# Altium project esp32h2-zigbee-blinds_v1.PrjPcb
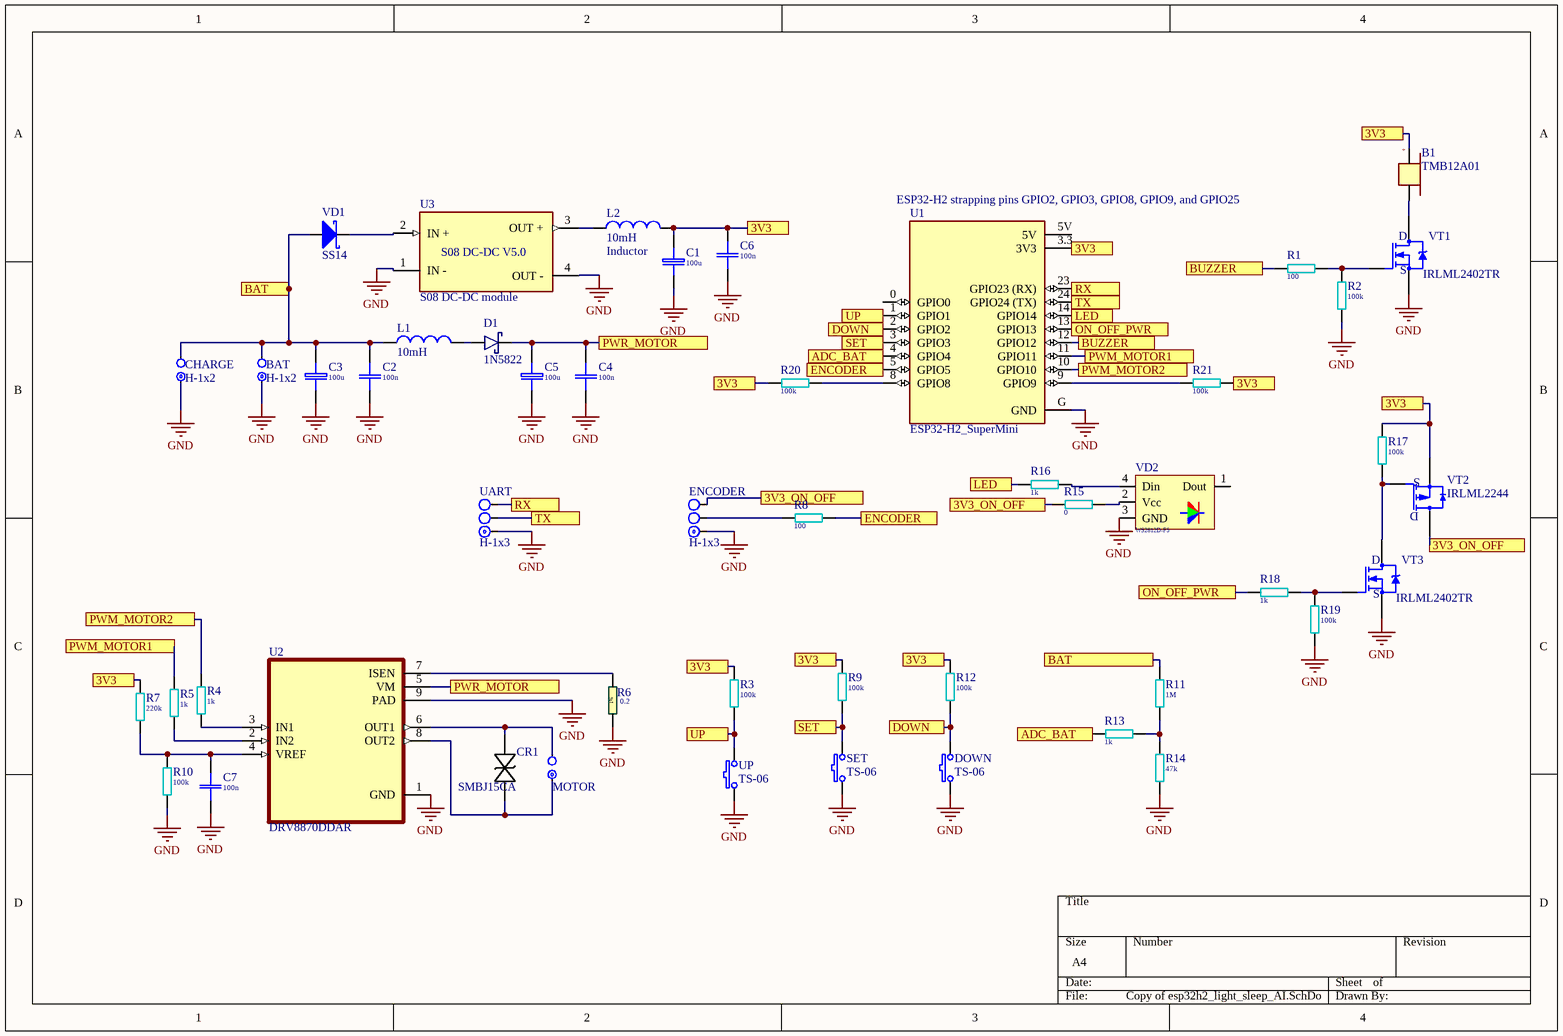
[diagram p0: Copy of esp32h2_light_sleep_AI.SchDoc]
2 sheets, 98 parts. Net scope: flat (ports and power ports of the same name join across sheets).
Board files: Copy of esp32h2_light_sleep_AI.PcbDoc, esp32h2_light_sleep.PcbDoc
Sheets:
  Copy of esp32h2_light_sleep_AI.SchDoc
  esp32h2_light_sleep.SchDoc

## Sheet Copy of esp32h2_light_sleep_AI.SchDoc
size A4; SheetNumber: 1; SheetTotal: 1

### Parts
(Parts that share a designator on the sheet are numbered #1, #2 ... from top to bottom, then left to right.)
B1#1  value TMB12A01  [Buzzer_TMB12AXX]
BAT#1  H-1x2  [J1x2]
C1#1  100u  [EL SMD Case D D6.3x6.6 h7.7(0605)]
C2#1  100n  [C1206(3216)]
C3#1  100u  [EL SMD Case D D6.3x6.6 h7.7(0605)]
C4#1  100n  [C1206(3216)]
C5#1  100u  [EL SMD Case D D6.3x6.6 h7.7(0605)]
C6#1  100n  [C1206(3216)]
C7#1  100n  [C1206(3216)]
CHARGE#1  H-1x2  [J1x2]
CR1#1  SMBJ15CA  [DIODE_DO214AA]
D1#1  1N5822  [DO201AD]
DOWN#1  TS-06  [TS-06]
ENCODER#1  H-1x3  [J1x3]
L1#1  value 10mH  [AXIAL-10x0.8]
L2#1  Inductor  value 10mH  [AXIAL-10x0.8]
MOTOR#1  H-1x2  [J1x2]  (value not drawn)
R1#1  100  [R1206]
R2#1  100k  [R1206]
R3#1  100k  [R1206]
R4#1  1k  [R1206]
R5#1  1k  [R1206]
R6#1  0.2  [R2512-1%]
R7#1  220k  [R1206]
R8#1  100  [R1206]
R9#1  100k  [R1206]
R10#1  100k  [R1206]
R11#1  1M  [R1206]
R12#1  100k  [R1206]
R13#1  1k  [R1206]
R14#1  47k  [R1206]
R15#1  0  [R1206]
R16#1  1k  [R1206]
R17#1  100k  [R1206]
R18#1  1k  [R1206]
R19#1  100k  [R1206]
R20#1  100k  [R1206]
R21#1  100k  [R1206]
SET#1  TS-06  [TS-06]
U1#1  ESP32-H2_SuperMini  [ESP32-H2_SuperMini]
U2#1  DRV8870DDAR  [VREG_LM5017MR/NOPB]
U3#1  S08 DC-DC module  [S08 DC-DC module]
UART#1  H-1x3  [J1x3]
UP#1  TS-06  [TS-06]
VD1#1  SS14  [SMA]
VD2#1  value WS2812D-F5  [WS2812D-F5 DIP 4 pin]  (hidden comment: XT1511-4020)
VT1#1  IRLML2402TR  [SOT-23]
VT2#1  IRLML2244  [SOT-23]
VT3#1  IRLML2402TR  [SOT-23]

### Ports
3V3 (see esp32h2_light_sleep[1C], esp32h2_light_sleep[2A], esp32h2_light_sleep[2B], esp32h2_light_sleep[2C], esp32h2_light_sleep[3A], esp32h2_light_sleep[3C], esp32h2_light_sleep[4A], esp32h2_light_sleep[4B]), 3V3 (see esp32h2_light_sleep[1C], esp32h2_light_sleep[2A], esp32h2_light_sleep[2B], esp32h2_light_sleep[2C], esp32h2_light_sleep[3A], esp32h2_light_sleep[3C], esp32h2_light_sleep[4B]), 3V3 (see esp32h2_light_sleep[1C], esp32h2_light_sleep[2A], esp32h2_light_sleep[2B], esp32h2_light_sleep[2C], esp32h2_light_sleep[3C], esp32h2_light_sleep[4A], esp32h2_light_sleep[4B]), 3V3 (see esp32h2_light_sleep[1C], esp32h2_light_sleep[2A], esp32h2_light_sleep[2B], esp32h2_light_sleep[3A], esp32h2_light_sleep[3C], esp32h2_light_sleep[4A], esp32h2_light_sleep[4B]), 3V3 (see esp32h2_light_sleep[1C], esp32h2_light_sleep[2A], esp32h2_light_sleep[2C], esp32h2_light_sleep[3A], esp32h2_light_sleep[3C], esp32h2_light_sleep[4A], esp32h2_light_sleep[4B]), 3V3 (see esp32h2_light_sleep[1C], esp32h2_light_sleep[2B], esp32h2_light_sleep[2C], esp32h2_light_sleep[3A], esp32h2_light_sleep[3C], esp32h2_light_sleep[4A], esp32h2_light_sleep[4B]), 3V3 (see esp32h2_light_sleep[2A], esp32h2_light_sleep[2B], esp32h2_light_sleep[2C], esp32h2_light_sleep[3A], esp32h2_light_sleep[3C], esp32h2_light_sleep[4A], esp32h2_light_sleep[4B]), 3V3_ON_OFF (see esp32h2_light_sleep[2B], esp32h2_light_sleep[3B]), 3V3_ON_OFF (see esp32h2_light_sleep[2B], esp32h2_light_sleep[4C]), 3V3_ON_OFF (see esp32h2_light_sleep[3B], esp32h2_light_sleep[4C]), ADC_BAT (see esp32h2_light_sleep[3B]), ADC_BAT (see esp32h2_light_sleep[3C]), BAT (see esp32h2_light_sleep[1B]), BAT (see esp32h2_light_sleep[3C]), BUZZER (see esp32h2_light_sleep[3B]), BUZZER (see esp32h2_light_sleep[4B]), DOWN (see esp32h2_light_sleep[3B]), DOWN (see esp32h2_light_sleep[3C]), ENCODER (see esp32h2_light_sleep[3B]), ENCODER (see esp32h2_light_sleep[3C]), LED (see esp32h2_light_sleep[3B]), ON_OFF_PWR (see esp32h2_light_sleep[3B]), ON_OFF_PWR (see esp32h2_light_sleep[3C]), PWM_MOTOR1 (see esp32h2_light_sleep[1C]), PWM_MOTOR1 (see esp32h2_light_sleep[3B]), PWM_MOTOR2 (see esp32h2_light_sleep[1C]), PWM_MOTOR2 (see esp32h2_light_sleep[3B]), PWR_MOTOR (see esp32h2_light_sleep[2B]), PWR_MOTOR (see esp32h2_light_sleep[2C]), RX (see esp32h2_light_sleep[2B]), RX (see esp32h2_light_sleep[3B]), SET (see esp32h2_light_sleep[3B]), SET (see esp32h2_light_sleep[3C]), TX (see esp32h2_light_sleep[2C]), TX (see esp32h2_light_sleep[3B]), UP (see esp32h2_light_sleep[2C]), UP (see esp32h2_light_sleep[3B])

### Nets
GND: BAT#1.1 C1#1.2(-) C2#1.2 C3#1.2(-) C4#1.2 C5#1.2(-) C6#1.2 C7#1.2 CHARGE#1.1 DOWN#1.1 ENCODER#1.1 R2#1.2 R6#1.1 R10#1.1 R14#1.1 R19#1.2 SET#1.1 U1#1.G(GND) U2#1.1(GND) U2#1.9(PAD) U3#1.1(IN_-) U3#1.4(OUT_-) UART#1.1 UP#1.1 VD2#1.3(GND) VT1#1.2(S) VT3#1.2(S)
NetB1#1_1: B1#1.1 C1#1.1(+) C6#1.1 L2#1.2 R3#1.2 R7#1.2 R9#1.2 R12#1.2 R17#1.1 R20#1.2 R21#1.1 U1#1.3.3(3V3) VT2#1.2(S) ; port 3V3
NetB1#1_2: B1#1.2 VT1#1.3(D)
NetBAT#1_2: BAT#1.2 C2#1.1 C3#1.1(+) CHARGE#1.2 L1#1.1 R11#1.2 VD1#1.1(A) ; port BAT
NetC4#1_1: C4#1.1 C5#1.1(+) D1#1.2 U2#1.5(VM) ; port PWR_MOTOR
NetC7#1_1: C7#1.1 R7#1.1 R10#1.2 U2#1.4(VREF)
NetCR1#1_1: CR1#1.1 MOTOR#1.2 U2#1.6(OUT1)
NetCR1#1_2: CR1#1.2 MOTOR#1.1 U2#1.8(OUT2)
NetD1#1_1: D1#1.1 L1#1.2
NetDOWN#1_2: DOWN#1.2 R12#1.1 U1#1.2(GPIO2) ; port DOWN
NetENCODER#1_2: ENCODER#1.2 R8#1.2
NetENCODER#1_3: ENCODER#1.3 R15#1.2 VT2#1.3(D) ; port 3V3_ON_OFF
NetL2#1_1: L2#1.1 U3#1.3(OUT_+)
NetR1#1_1: R1#1.1 R2#1.1 VT1#1.1(G)
NetR1#1_2: R1#1.2 U1#1.12(GPIO12) ; port BUZZER
NetR3#1_1: R3#1.1 U1#1.1(GPIO1) UP#1.2 ; port UP
NetR4#1_1: R4#1.1 U2#1.3(IN1)
NetR4#1_2: R4#1.2 U1#1.10(GPIO10) ; port PWM_MOTOR2
NetR5#1_1: R5#1.1 U2#1.2(IN2)
NetR5#1_2: R5#1.2 U1#1.11(GPIO11) ; port PWM_MOTOR1
NetR6#1_2: R6#1.2 U2#1.7(ISEN)
NetR8#1_1: R8#1.1 U1#1.5(GPIO5) ; port ENCODER
NetR9#1_1: R9#1.1 SET#1.2 U1#1.3(GPIO3) ; port SET
NetR11#1_1: R11#1.1 R13#1.1 R14#1.2
NetR13#1_2: R13#1.2 U1#1.4(GPIO4) ; port ADC_BAT
NetR15#1_1: R15#1.1 VD2#1.2(Vcc)
NetR16#1_1: R16#1.1 VD2#1.4(Din)
NetR16#1_2: R16#1.2 U1#1.14(GPIO14) ; port LED
NetR17#1_2: R17#1.2 VT2#1.1(G) VT3#1.3(D)
NetR18#1_1: R18#1.1 R19#1.1 VT3#1.1(G)
NetR18#1_2: R18#1.2 U1#1.13(GPIO13) ; port ON_OFF_PWR
NetR20#1_1: R20#1.1 U1#1.8(GPIO8)
NetR21#1_2: R21#1.2 U1#1.9(GPIO9)
NetU1#1_23: U1#1.23(GPIO23_(RX)) UART#1.3 ; port RX
NetU1#1_24: U1#1.24(GPIO24_(TX)) UART#1.2 ; port TX
NetU3#1_2: U3#1.2(IN_+) VD1#1.2(2.)

Not connected (* = marked no-connect by the designer): U1#1 0(GPIO0) 5V; VD2#1 1(Dout)

### Notes on the sheet
- (near U1#1) ESP32-H2 strapping pins GPIO2, GPIO3, GPIO8, GPIO9, and GPIO25
- (in symbol B) +
- (in symbol R-2512-1%) 1%
- (in symbol S08 DC-DC module) S08 DC-DC V5.0

### Library data of the parts
B1#1 = B: Active Buzzer 1.5/3.0V 75DB; Montage: Выводной; Contacts: 2; Family: Пищалка
C1#1 C3#1 C5#1 = EL 100u/35V-2: EL 35V SMD Case D D6.3x6.6 h7.7(0605); Price: 0.014; Value: 100u
C2#1 C4#1 C6#1 C7#1 = C-1206: SMD-1206; Price: 0.014; Value: 100n
CR1#1 = SMBJ15CA: Description; Manufacturer_Name: Bourns Electronics; Copyright: Copyright (C) 2026 Ultra Librarian. All rights reserved.; Manufacturer_Part_Number: SMBJ15CA
D1#1 = 1N5822: Diode Schottky 40V 3A DO201AD; Digikey PN: 497-11370-1-ND; Mouser PN: 511-1N5822; JLCPCB PN: C3018526
DOWN#1 SET#1 UP#1 = Buton TS-06: Price: 0.15
L1#1 L2#1 = Inductor: Code_IEC: 1005; Published: 8-Jun-2000; LatestRevisionDate: 29-May-2009; LatestRevisionNote: IPC-7351 Footprint Added.; PackageReference: 0402-A; Publisher: Altium Limited; PackageDescription: Chip Inductor; Code_JEITA: 0402
R1#1 R2#1 R3#1 R4#1 R5#1 R7#1 R8#1 R9#1 R10#1 R11#1 R12#1 R13#1 R14#1 R15#1 R16#1 R17#1 R18#1 R19#1 R20#1 R21#1 = R-1206: SMD 1206 0.125W 5% 200V; Price: 0.045
  R1#1 R8#1: Value: 100
  R2#1 R3#1 R9#1 R10#1 R12#1 R17#1 R19#1 R20#1 R21#1: Value: 100k
  R4#1 R5#1 R13#1 R16#1 R18#1: Value: 1k
  R7#1: Value: 220k
  R11#1: Value: 1M
  R14#1: Value: 47k
  R15#1: Value: 0
R6#1 = R-2512-1%: SMD 2512 1W 1% 200V; Price: 0.288; Value: 0.2
U1#1 = ESP32-H2_SuperMini: Zero ESP32-H2 board; MF: Espressif Systems; MP: ESP32-C3 Zero; Package: Package; Value: *; Check_prices: https://www.snapeda.com/parts/ESP32-C3%20SuperMini_TH/Espressif+Systems/view-part/?ref=eda
U2#1 = DRV8870DDAR: å…·æœ‰ç”µæµè°ƒèŠ‚åŠŸèƒ½çš„ 50 Vã€3.6 A H æ¡¥ç”µæœºé©±åŠ¨å™¨; MF: Texas Instruments; SnapEDA_Link: https://www.snapeda.com/parts/DRV8870DDAR/Texas+Instruments/view-part/?ref=snap; Package: HSOIC-8 Texas Instruments; Value: *; MP: DRV8870DDAR; Check_prices: https://www.snapeda.com/parts/DRV8870DDAR/Texas+Instruments/view-part/?ref=eda
U3#1 = S08 DC-DC module: S08 DC-DC module V5.0; MF: Espressif Systems; MP: ESP32-C3 Zero; Package: Package; Value: *; Check_prices: https://www.snapeda.com/parts/ESP32-C3%20SuperMini_TH/Espressif+Systems/view-part/?ref=eda
VD1#1 = VD_8: DIODE SMD Шоттки SS14 1A 40v SMA; Manufacturer: Diodes Inc.; Voltage: 20v; Family: Диод; Montage: SMD; Type: Шоттки; Package: SMA; Current: 1A; Value: SS14
VD2#1 = WS2812D-F5: DIP RGB Адресуемый светодиод аналог WS2812; Manufacturer: EZIUSIN; Montage: SMD; Voltage: 2.0/3.0v; Current: 0.005A; Family: Диод RGB; Type: Светодиод; Package: 4020; PartNumber: XT1511-4020; Vender: https://ru.aliexpress.com/store/product/Jercio-50-1500-XT1511-4020-WS2812b-SK6812-4020-RGB-DC-5/4170004_32890356895.html?ws_ab_test=searchweb0_0%2Csearchweb201602_1_5724111_10065_5930011_10068_5724211_5890011_5724311_10696_5724011_10084_10083_10618_5940011_5970011_10307_5723511_10301_5920011_5910011_5724411_10059_5900011_100031_5725111_10103_5724811_5725011_5990011_5724911_5980011%2Csearchweb201603_56%2CppcSwitch_2&algo_expid=625c825e-e2ae-42fa-880c-28dc549fd929-13&algo_pvid=625c825e-e2ae-42fa-880c-28dc549fd929&transAbTest=ae803_1&priceBeautifyAB=0
VT1#1 VT3#1 = VT_2: TRANSISTOR SMD MOSFET IRLML0040 3.6A 40v 0.078Ω SOT23; Manufacturer: International Rectifier; Structure: N-channel; Family: Транзистор; Montage: SMD; Type: MOSFET; Voltage: 40v; Package: SOT23; Current: 3.6A; Resistance: 0.078Ω; Value: IRLML2402TR
VT2#1 = VT_5: FET-P SMD IRLML6402 3.7A 20v 0.065Ω SOT23; Manufacturer: International Rectifier; Type: MOSFET; Structure: P-channel; Family: Транзистор; Montage: SMD; Voltage: 20v; Package: SOT23; Current: 3.7A; Resistance: 0.065Ω; Value: IRLML2244
BAT#1 CHARGE#1 MOTOR#1 = H-1x2: Price: 0.02
ENCODER#1 UART#1 = H-1x3: Price: 0.03

## Sheet esp32h2_light_sleep.SchDoc
size A4; SheetNumber: 1; SheetTotal: 1
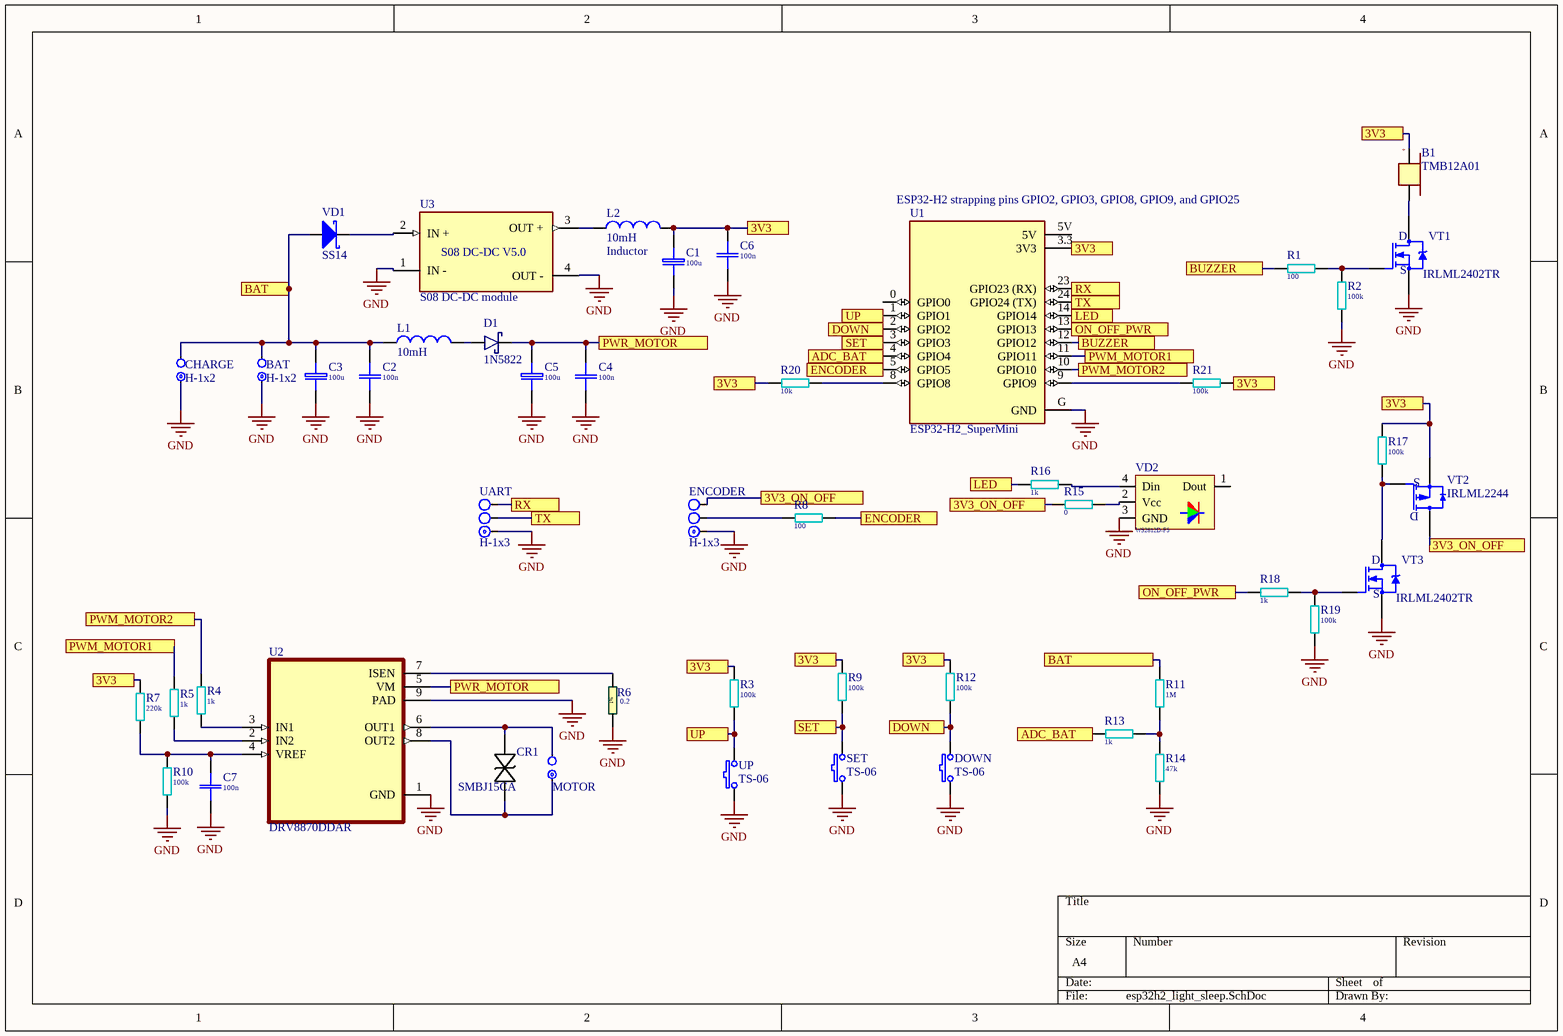
[diagram p1: esp32h2_light_sleep.SchDoc]

### Parts
(Parts that share a designator on the sheet are numbered #1, #2 ... from top to bottom, then left to right.)
B1#2  value TMB12A01  [Buzzer_TMB12AXX]
BAT#2  H-1x2  [J1x2]
C1#2  100u  [EL SMD Case D D6.3x6.6 h7.7(0605)]
C2#2  100n  [C1206(3216)]
C3#2  100u  [EL SMD Case D D6.3x6.6 h7.7(0605)]
C4#2  100n  [C1206(3216)]
C5#2  100u  [EL SMD Case D D6.3x6.6 h7.7(0605)]
C6#2  100n  [C1206(3216)]
C7#2  100n  [C1206(3216)]
CHARGE#2  H-1x2  [J1x2]
CR1#2  SMBJ15CA  [DIODE_DO214AA]
D1#2  1N5822  [DO201AD]
DOWN#2  TS-06  [TS-06]
ENCODER#2  H-1x3  [J1x3]
L1#2  value 10mH  [AXIAL-10x0.8]
L2#2  Inductor  value 10mH  [AXIAL-10x0.8]
MOTOR#2  H-1x2  [J1x2]  (value not drawn)
R1#2  100  [R1206]
R2#2  100k  [R1206]
R3#2  100k  [R1206]
R4#2  1k  [R1206]
R5#2  1k  [R1206]
R6#2  0.2  [R2512-1%]
R7#2  220k  [R1206]
R8#2  100  [R1206]
R9#2  100k  [R1206]
R10#2  100k  [R1206]
R11#2  1M  [R1206]
R12#2  100k  [R1206]
R13#2  1k  [R1206]
R14#2  47k  [R1206]
R15#2  0  [R1206]
R16#2  1k  [R1206]
R17#2  100k  [R1206]
R18#2  1k  [R1206]
R19#2  100k  [R1206]
R20#2  10k  [R1206]
R21#2  100k  [R1206]
SET#2  TS-06  [TS-06]
U1#2  ESP32-H2_SuperMini  [ESP32-H2_SuperMini]
U2#2  DRV8870DDAR  [VREG_LM5017MR/NOPB]
U3#2  S08 DC-DC module  [S08 DC-DC module]
UART#2  H-1x3  [J1x3]
UP#2  TS-06  [TS-06]
VD1#2  SS14  [SMA]
VD2#2  value WS2812D-F5  [WS2812D-F5 DIP 4 pin]  (hidden comment: XT1511-4020)
VT1#2  IRLML2402TR  [SOT-23]
VT2#2  IRLML2244  [SOT-23]
VT3#2  IRLML2402TR  [SOT-23]

### Ports
3V3 (see esp32h2_light_sleep[1C], esp32h2_light_sleep[2A], esp32h2_light_sleep[2B], esp32h2_light_sleep[2C], esp32h2_light_sleep[3A], esp32h2_light_sleep[3C], esp32h2_light_sleep[4A], esp32h2_light_sleep[4B]), 3V3 (see esp32h2_light_sleep[1C], esp32h2_light_sleep[2A], esp32h2_light_sleep[2B], esp32h2_light_sleep[2C], esp32h2_light_sleep[3A], esp32h2_light_sleep[3C], esp32h2_light_sleep[4B]), 3V3 (see esp32h2_light_sleep[1C], esp32h2_light_sleep[2A], esp32h2_light_sleep[2B], esp32h2_light_sleep[2C], esp32h2_light_sleep[3C], esp32h2_light_sleep[4A], esp32h2_light_sleep[4B]), 3V3 (see esp32h2_light_sleep[1C], esp32h2_light_sleep[2A], esp32h2_light_sleep[2B], esp32h2_light_sleep[3A], esp32h2_light_sleep[3C], esp32h2_light_sleep[4A], esp32h2_light_sleep[4B]), 3V3 (see esp32h2_light_sleep[1C], esp32h2_light_sleep[2A], esp32h2_light_sleep[2C], esp32h2_light_sleep[3A], esp32h2_light_sleep[3C], esp32h2_light_sleep[4A], esp32h2_light_sleep[4B]), 3V3 (see esp32h2_light_sleep[1C], esp32h2_light_sleep[2B], esp32h2_light_sleep[2C], esp32h2_light_sleep[3A], esp32h2_light_sleep[3C], esp32h2_light_sleep[4A], esp32h2_light_sleep[4B]), 3V3 (see esp32h2_light_sleep[2A], esp32h2_light_sleep[2B], esp32h2_light_sleep[2C], esp32h2_light_sleep[3A], esp32h2_light_sleep[3C], esp32h2_light_sleep[4A], esp32h2_light_sleep[4B]), 3V3_ON_OFF (see esp32h2_light_sleep[2B], esp32h2_light_sleep[3B]), 3V3_ON_OFF (see esp32h2_light_sleep[2B], esp32h2_light_sleep[4C]), 3V3_ON_OFF (see esp32h2_light_sleep[3B], esp32h2_light_sleep[4C]), ADC_BAT (see esp32h2_light_sleep[3B]), ADC_BAT (see esp32h2_light_sleep[3C]), BAT (see esp32h2_light_sleep[1B]), BAT (see esp32h2_light_sleep[3C]), BUZZER (see esp32h2_light_sleep[3B]), BUZZER (see esp32h2_light_sleep[4B]), DOWN (see esp32h2_light_sleep[3B]), DOWN (see esp32h2_light_sleep[3C]), ENCODER (see esp32h2_light_sleep[3B]), ENCODER (see esp32h2_light_sleep[3C]), LED (see esp32h2_light_sleep[3B]), ON_OFF_PWR (see esp32h2_light_sleep[3B]), ON_OFF_PWR (see esp32h2_light_sleep[3C]), PWM_MOTOR1 (see esp32h2_light_sleep[1C]), PWM_MOTOR1 (see esp32h2_light_sleep[3B]), PWM_MOTOR2 (see esp32h2_light_sleep[1C]), PWM_MOTOR2 (see esp32h2_light_sleep[3B]), PWR_MOTOR (see esp32h2_light_sleep[2B]), PWR_MOTOR (see esp32h2_light_sleep[2C]), RX (see esp32h2_light_sleep[2B]), RX (see esp32h2_light_sleep[3B]), SET (see esp32h2_light_sleep[3B]), SET (see esp32h2_light_sleep[3C]), TX (see esp32h2_light_sleep[2C]), TX (see esp32h2_light_sleep[3B]), UP (see esp32h2_light_sleep[2C]), UP (see esp32h2_light_sleep[3B])

### Nets
GND: BAT#2.1 C1#2.2(-) C2#2.2 C3#2.2(-) C4#2.2 C5#2.2(-) C6#2.2 C7#2.2 CHARGE#2.1 DOWN#2.1 ENCODER#2.1 R2#2.2 R6#2.1 R10#2.1 R14#2.1 R19#2.2 SET#2.1 U1#2.G(GND) U2#2.1(GND) U2#2.9(PAD) U3#2.1(IN_-) U3#2.4(OUT_-) UART#2.1 UP#2.1 VD2#2.3(GND) VT1#2.2(S) VT3#2.2(S)
NetB1#1_1: B1#2.1 C1#2.1(+) C6#2.1 L2#2.2 R3#2.2 R7#2.2 R9#2.2 R12#2.2 R17#2.1 R20#2.2 R21#2.1 U1#2.3.3(3V3) VT2#2.2(S) ; port 3V3
NetB1#2_2: B1#2.2 VT1#2.3(D)
NetBAT#1_2: BAT#2.2 C2#2.1 C3#2.1(+) CHARGE#2.2 L1#2.1 R11#2.2 VD1#2.1(A) ; port BAT
NetC4#1_1: C4#2.1 C5#2.1(+) D1#2.2 U2#2.5(VM) ; port PWR_MOTOR
NetC7#2_1: C7#2.1 R7#2.1 R10#2.2 U2#2.4(VREF)
NetCR1#2_1: CR1#2.1 MOTOR#2.2 U2#2.6(OUT1)
NetCR1#2_2: CR1#2.2 MOTOR#2.1 U2#2.8(OUT2)
NetD1#2_1: D1#2.1 L1#2.2
NetDOWN#1_2: DOWN#2.2 R12#2.1 U1#2.2(GPIO2) ; port DOWN
NetENCODER#1_3: ENCODER#2.3 R15#2.2 VT2#2.3(D) ; port 3V3_ON_OFF
NetENCODER#2_2: ENCODER#2.2 R8#2.2
NetL2#2_1: L2#2.1 U3#2.3(OUT_+)
NetR1#1_2: R1#2.2 U1#2.12(GPIO12) ; port BUZZER
NetR1#2_1: R1#2.1 R2#2.1 VT1#2.1(G)
NetR3#1_1: R3#2.1 U1#2.1(GPIO1) UP#2.2 ; port UP
NetR4#1_2: R4#2.2 U1#2.10(GPIO10) ; port PWM_MOTOR2
NetR4#2_1: R4#2.1 U2#2.3(IN1)
NetR5#1_2: R5#2.2 U1#2.11(GPIO11) ; port PWM_MOTOR1
NetR5#2_1: R5#2.1 U2#2.2(IN2)
NetR6#2_2: R6#2.2 U2#2.7(ISEN)
NetR8#1_1: R8#2.1 U1#2.5(GPIO5) ; port ENCODER
NetR9#1_1: R9#2.1 SET#2.2 U1#2.3(GPIO3) ; port SET
NetR11#2_1: R11#2.1 R13#2.1 R14#2.2
NetR13#1_2: R13#2.2 U1#2.4(GPIO4) ; port ADC_BAT
NetR15#2_1: R15#2.1 VD2#2.2(Vcc)
NetR16#1_2: R16#2.2 U1#2.14(GPIO14) ; port LED
NetR16#2_1: R16#2.1 VD2#2.4(Din)
NetR17#2_2: R17#2.2 VT2#2.1(G) VT3#2.3(D)
NetR18#1_2: R18#2.2 U1#2.13(GPIO13) ; port ON_OFF_PWR
NetR18#2_1: R18#2.1 R19#2.1 VT3#2.1(G)
NetR20#2_1: R20#2.1 U1#2.8(GPIO8)
NetR21#2_2: R21#2.2 U1#2.9(GPIO9)
NetU1#1_23: U1#2.23(GPIO23_(RX)) UART#2.3 ; port RX
NetU1#1_24: U1#2.24(GPIO24_(TX)) UART#2.2 ; port TX
NetU3#2_2: U3#2.2(IN_+) VD1#2.2(2.)

Not connected (* = marked no-connect by the designer): U1#2 0(GPIO0) 5V; VD2#2 1(Dout)

### Notes on the sheet
- (near U1#2) ESP32-H2 strapping pins GPIO2, GPIO3, GPIO8, GPIO9, and GPIO25
- (in symbol B) +
- (in symbol R-2512-1%) 1%
- (in symbol S08 DC-DC module) S08 DC-DC V5.0

### Library data of the parts
B1#2 = B: as B1#1 on sheet Copy of esp32h2_light_sleep_AI; Family: Пищалка
C1#2 C3#2 C5#2 = EL 100u/35V-2: EL 35V SMD Case D D6.3x6.6 h7.7(0605); Price: 0.014; Value: 100u
C2#2 C4#2 C6#2 C7#2 = C-1206: SMD-1206; Price: 0.014; Value: 100n
CR1#2 = SMBJ15CA: as CR1#1 on sheet Copy of esp32h2_light_sleep_AI; Copyright: Copyright (C) 2026 Ultra Librarian. All rights reserved.; Manufacturer_Part_Number: SMBJ15CA
D1#2 = 1N5822: Diode Schottky 40V 3A DO201AD; Digikey PN: 497-11370-1-ND; Mouser PN: 511-1N5822; JLCPCB PN: C3018526
DOWN#2 SET#2 UP#2 = Buton TS-06: Price: 0.15
L1#2 L2#2 = Inductor: Code_IEC: 1005; Published: 8-Jun-2000; LatestRevisionDate: 29-May-2009; LatestRevisionNote: IPC-7351 Footprint Added.; PackageReference: 0402-A; Publisher: Altium Limited; PackageDescription: Chip Inductor; Code_JEITA: 0402
R1#2 R2#2 R3#2 R4#2 R5#2 R7#2 R8#2 R9#2 R10#2 R11#2 R12#2 R13#2 R14#2 R15#2 R16#2 R17#2 R18#2 R19#2 R20#2 R21#2 = R-1206: SMD 1206 0.125W 5% 200V; Price: 0.045
  R1#2 R8#2: Value: 100
  R2#2 R3#2 R9#2 R10#2 R12#2 R17#2 R19#2 R21#2: Value: 100k
  R4#2 R5#2 R13#2 R16#2 R18#2: Value: 1k
  R7#2: Value: 220k
  R11#2: Value: 1M
  R14#2: Value: 47k
  R15#2: Value: 0
  R20#2: Value: 10k
R6#2 = R-2512-1%: SMD 2512 1W 1% 200V; Price: 0.288; Value: 0.2
U1#2 = ESP32-H2_SuperMini: as U1#1 on sheet Copy of esp32h2_light_sleep_AI; Package: Package; Value: *; Check_prices: https://www.snapeda.com/parts/ESP32-C3%20SuperMini_TH/Espressif+Systems/view-part/?ref=eda
U2#2 = DRV8870DDAR: as U2#1 on sheet Copy of esp32h2_light_sleep_AI; SnapEDA_Link: https://www.snapeda.com/parts/DRV8870DDAR/Texas+Instruments/view-part/?ref=snap; Package: HSOIC-8 Texas Instruments; Value: *; MP: DRV8870DDAR; Check_prices: https://www.snapeda.com/parts/DRV8870DDAR/Texas+Instruments/view-part/?ref=eda
U3#2 = S08 DC-DC module: as U3#1 on sheet Copy of esp32h2_light_sleep_AI; Package: Package; Value: *; Check_prices: https://www.snapeda.com/parts/ESP32-C3%20SuperMini_TH/Espressif+Systems/view-part/?ref=eda
VD1#2 = VD_8: as VD1#1 on sheet Copy of esp32h2_light_sleep_AI; Family: Диод; Montage: SMD; Type: Шоттки; Package: SMA; Current: 1A; Value: SS14
VD2#2 = WS2812D-F5: as VD2#1 on sheet Copy of esp32h2_light_sleep_AI; Family: Диод RGB; Type: Светодиод; Package: 4020; PartNumber: XT1511-4020; Vender: https://ru.aliexpress.com/store/product/Jercio-50-1500-XT1511-4020-WS2812b-SK6812-4020-RGB-DC-5/4170004_32890356895.html?ws_ab_test=searchweb0_0%2Csearchweb201602_1_5724111_10065_5930011_10068_5724211_5890011_5724311_10696_5724011_10084_10083_10618_5940011_5970011_10307_5723511_10301_5920011_5910011_5724411_10059_5900011_100031_5725111_10103_5724811_5725011_5990011_5724911_5980011%2Csearchweb201603_56%2CppcSwitch_2&algo_expid=625c825e-e2ae-42fa-880c-28dc549fd929-13&algo_pvid=625c825e-e2ae-42fa-880c-28dc549fd929&transAbTest=ae803_1&priceBeautifyAB=0
VT1#2 VT3#2 = VT_2: as VT1#1 on sheet Copy of esp32h2_light_sleep_AI; Family: Транзистор; Montage: SMD; Type: MOSFET; Voltage: 40v; Package: SOT23; Current: 3.6A; Resistance: 0.078Ω; Value: IRLML2402TR
VT2#2 = VT_5: as VT2#1 on sheet Copy of esp32h2_light_sleep_AI; Family: Транзистор; Montage: SMD; Voltage: 20v; Package: SOT23; Current: 3.7A; Resistance: 0.065Ω; Value: IRLML2244
BAT#2 CHARGE#2 MOTOR#2 = H-1x2: Price: 0.02
ENCODER#2 UART#2 = H-1x3: Price: 0.03

## Nets that join several sheets
GND: Copy of esp32h2_light_sleep_AI (27 pins), esp32h2_light_sleep (27 pins)
NetB1#1_1: Copy of esp32h2_light_sleep_AI (13 pins), esp32h2_light_sleep (13 pins)
NetBAT#1_2: Copy of esp32h2_light_sleep_AI (7 pins), esp32h2_light_sleep (7 pins)
NetC4#1_1: Copy of esp32h2_light_sleep_AI (C4#1.1 C5#1.1 D1#1.2 U2#1.5), esp32h2_light_sleep (C4#2.1 C5#2.1 D1#2.2 U2#2.5)
NetDOWN#1_2: Copy of esp32h2_light_sleep_AI (DOWN#1.2 R12#1.1 U1#1.2), esp32h2_light_sleep (DOWN#2.2 R12#2.1 U1#2.2)
NetENCODER#1_3: Copy of esp32h2_light_sleep_AI (ENCODER#1.3 R15#1.2 VT2#1.3), esp32h2_light_sleep (ENCODER#2.3 R15#2.2 VT2#2.3)
NetR1#1_2: Copy of esp32h2_light_sleep_AI (R1#1.2 U1#1.12), esp32h2_light_sleep (R1#2.2 U1#2.12)
NetR3#1_1: Copy of esp32h2_light_sleep_AI (R3#1.1 U1#1.1 UP#1.2), esp32h2_light_sleep (R3#2.1 U1#2.1 UP#2.2)
NetR4#1_2: Copy of esp32h2_light_sleep_AI (R4#1.2 U1#1.10), esp32h2_light_sleep (R4#2.2 U1#2.10)
NetR5#1_2: Copy of esp32h2_light_sleep_AI (R5#1.2 U1#1.11), esp32h2_light_sleep (R5#2.2 U1#2.11)
NetR8#1_1: Copy of esp32h2_light_sleep_AI (R8#1.1 U1#1.5), esp32h2_light_sleep (R8#2.1 U1#2.5)
NetR9#1_1: Copy of esp32h2_light_sleep_AI (R9#1.1 SET#1.2 U1#1.3), esp32h2_light_sleep (R9#2.1 SET#2.2 U1#2.3)
NetR13#1_2: Copy of esp32h2_light_sleep_AI (R13#1.2 U1#1.4), esp32h2_light_sleep (R13#2.2 U1#2.4)
NetR16#1_2: Copy of esp32h2_light_sleep_AI (R16#1.2 U1#1.14), esp32h2_light_sleep (R16#2.2 U1#2.14)
NetR18#1_2: Copy of esp32h2_light_sleep_AI (R18#1.2 U1#1.13), esp32h2_light_sleep (R18#2.2 U1#2.13)
NetU1#1_23: Copy of esp32h2_light_sleep_AI (U1#1.23 UART#1.3), esp32h2_light_sleep (U1#2.23 UART#2.3)
NetU1#1_24: Copy of esp32h2_light_sleep_AI (U1#1.24 UART#1.2), esp32h2_light_sleep (U1#2.24 UART#2.2)